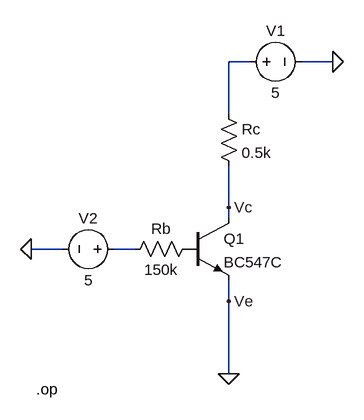
[diagram p0: schematic BJT switch.asc]
BJT switch.asc, the LTspice schematic file:
Version 4.1
SHEET 1 880 680
WIRE 192 -96 160 -96
WIRE 320 -96 272 -96
WIRE 160 -16 160 -96
WIRE 160 128 160 64
WIRE 160 144 160 128
WIRE -96 192 -144 192
WIRE 16 192 -16 192
WIRE 160 272 160 240
WIRE 160 384 160 272
FLAG 160 128 Vc
FLAG 160 272 Ve
FLAG 320 -96 0
FLAG 160 384 0
FLAG -144 192 0
SYMBOL npn 96 144 R0
SYMATTR InstName Q1
SYMATTR Value BC547C
SYMBOL res 144 -32 R0
SYMATTR InstName Rc
SYMATTR Value 0.5k
SYMBOL res 112 176 R90
WINDOW 0 0 56 VBottom 2
WINDOW 3 32 56 VTop 2
SYMATTR InstName Rb
SYMATTR Value 150k
SYMBOL voltage 176 -96 R270
WINDOW 0 32 56 VTop 2
WINDOW 3 -32 56 VBottom 2
WINDOW 123 0 0 Left 0
WINDOW 39 0 0 Left 0
SYMATTR InstName V1
SYMATTR Value 5
SYMBOL voltage 0 192 R90
WINDOW 0 -32 56 VBottom 2
WINDOW 3 32 56 VTop 2
WINDOW 123 0 0 Left 0
WINDOW 39 0 0 Left 0
SYMATTR InstName V2
SYMATTR Value 5
TEXT -136 408 Left 2 !.op

The netlist it stands for:
* BJT switch.asc
Q1 Vc P001 0 0 BC547C
Rc N001 Vc 0.5k
Rb P001 N002 150k
V1 N001 0 5
V2 N002 0 5
.model NPN NPN
.model PNP PNP
.lib standard.bjt
.op
.backanno
.end